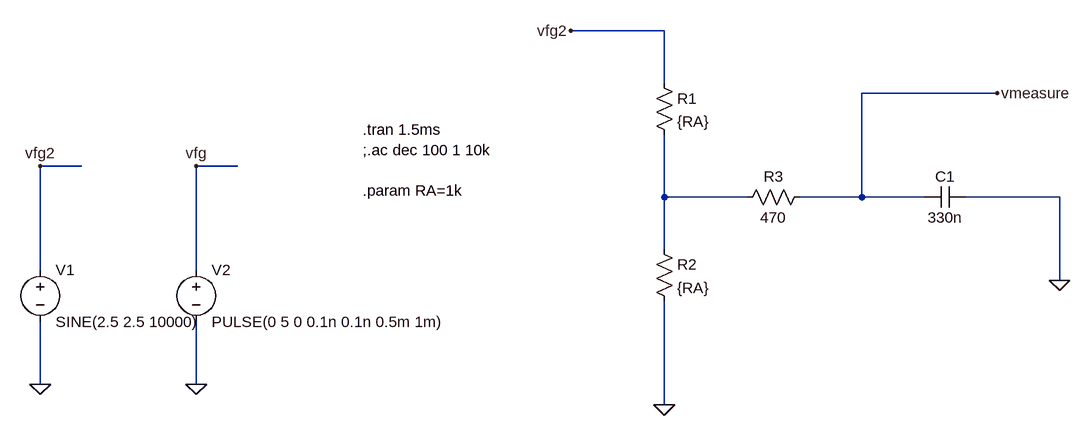
[diagram p0: schematic hardware task 1.asc]
hardware task 1.asc, the LTspice schematic file:
Version 4.1
SHEET 1 1636 680
WIRE 992 -256 848 -256
WIRE 992 -176 992 -256
WIRE 1504 -160 1296 -160
WIRE 96 -48 32 -48
WIRE 336 -48 272 -48
WIRE 992 0 992 -96
WIRE 1120 0 992 0
WIRE 1296 0 1296 -160
WIRE 1296 0 1200 0
WIRE 1392 0 1296 0
WIRE 1600 0 1456 0
WIRE 992 80 992 0
WIRE 32 112 32 -48
WIRE 272 112 272 -48
WIRE 1600 128 1600 0
WIRE 32 288 32 192
WIRE 272 288 272 192
WIRE 992 320 992 160
FLAG 32 288 0
FLAG 272 288 0
FLAG 32 -48 vfg2
FLAG 272 -48 vfg
FLAG 1600 128 0
FLAG 992 320 0
FLAG 848 -256 vfg2
FLAG 1504 -160 vmeasure
SYMBOL voltage 32 96 R0
WINDOW 123 0 0 Left 0
WINDOW 39 0 0 Left 0
SYMATTR InstName V1
SYMATTR Value SINE(2.5 2.5 10000)
SYMBOL voltage 272 96 R0
WINDOW 123 0 0 Left 0
WINDOW 39 0 0 Left 0
SYMATTR InstName V2
SYMATTR Value PULSE(0 5 0 0.1n 0.1n 0.5m 1m)
SYMBOL res 976 -192 R0
SYMATTR InstName R1
SYMATTR Value {RA}
SYMBOL res 976 64 R0
SYMATTR InstName R2
SYMATTR Value {RA}
SYMBOL res 1216 -16 R90
WINDOW 0 0 56 VBottom 2
WINDOW 3 32 56 VTop 2
SYMATTR InstName R3
SYMATTR Value 470
SYMBOL cap 1456 -16 R90
WINDOW 0 0 32 VBottom 2
WINDOW 3 32 32 VTop 2
SYMATTR InstName C1
SYMATTR Value 330n
TEXT 528 -104 Left 2 !.tran 1.5ms\n;.ac dec 100 1 10k\n \n.param RA=1k

The netlist it stands for:
* hardware task 1.asc
V1 vfg2 0 SINE(2.5 2.5 10000)
V2 vfg 0 PULSE(0 5 0 0.1n 0.1n 0.5m 1m)
R1 vfg2 N001 {RA}
R2 N001 0 {RA}
R3 vmeasure N001 470
C1 0 vmeasure 330n
.tran 1.5ms
;.ac dec 100 1 10k
.param RA=1k
.backanno
.end

* Results of the author's LTspice run, read from the files saved beside the schematic
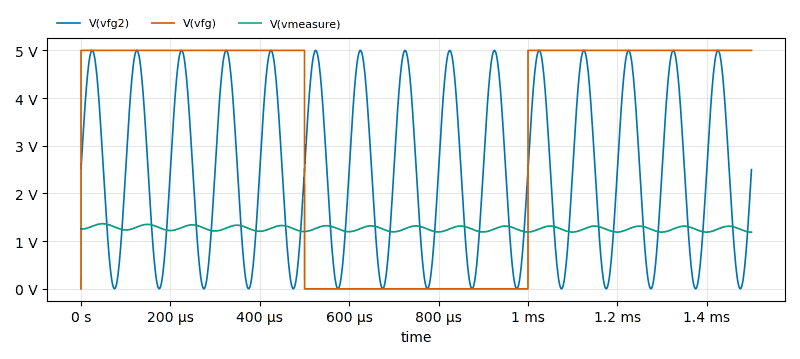
[diagram p1: Transient Analysis of hardware task 1.asc, plotted from the saved traces]
* Transient Analysis, 1 run:
*   V(vfg2): min 72.03 µV, max 5 V, average 2.5 V, rms 3.062 V, last 2.5 V
*   V(vfg): min 0 V, max 5 V, average 3.333 V, rms 4.082 V, last 5 V
*   V(vmeasure): min 1.189 V, max 1.365 V, average 1.263 V, rms 1.264 V, last 1.189 V